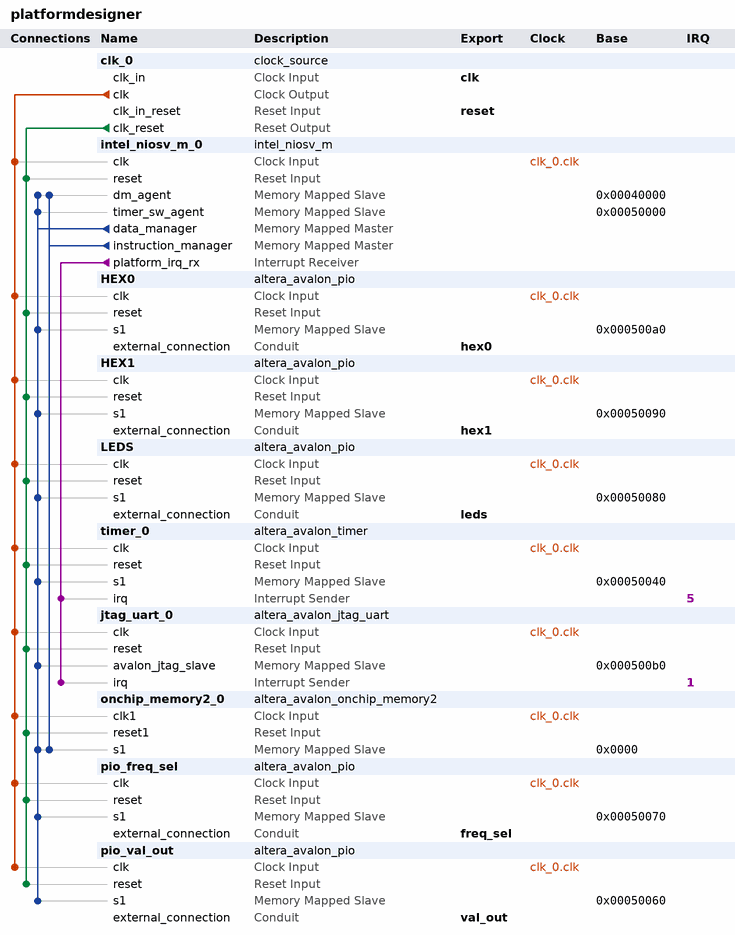
[diagram p0: system contents]
# Platform Designer (Qsys) system platformdesigner, Cyclone V 5CSEMA5F31C6
# Parameters at their usual value, and those the tool derives, are not listed.
package require -exact qsys 24.1
create_system platformdesigner
set_project_property DEVICE_FAMILY {Cyclone V}
set_project_property DEVICE 5CSEMA5F31C6

add_instance clk_0 clock_source 24.1
set_instance_parameter_value clk_0 clockFrequency 50000000

add_instance intel_niosv_m_0 intel_niosv_m 26.0.0
set_instance_parameter_value intel_niosv_m_0 enableAvalonInterface false
set_instance_parameter_value intel_niosv_m_0 enableDebugReset false
set_instance_parameter_value intel_niosv_m_0 enableECCLite false
set_instance_parameter_value intel_niosv_m_0 hartId 0
set_instance_parameter_value intel_niosv_m_0 interruptMode 0
set_instance_parameter_value intel_niosv_m_0 pipelineArch true
set_instance_parameter_value intel_niosv_m_0 resetSlave Absolute

add_instance HEX0 altera_avalon_pio 24.1
set_instance_parameter_value HEX0 direction Output
set_instance_parameter_value HEX0 width 7

add_instance HEX1 altera_avalon_pio 24.1
set_instance_parameter_value HEX1 direction Output
set_instance_parameter_value HEX1 width 7

add_instance LEDS altera_avalon_pio 24.1
set_instance_parameter_value LEDS direction Output
set_instance_parameter_value LEDS width 2

add_instance timer_0 altera_avalon_timer 24.1
set_instance_parameter_value timer_0 period 1
set_instance_parameter_value timer_0 periodUnits MSEC

add_instance jtag_uart_0 altera_avalon_jtag_uart 24.1
set_instance_parameter_value jtag_uart_0 simInteractiveOptions NO_INTERACTIVE_WINDOWS

add_instance onchip_memory2_0 altera_avalon_onchip_memory2 24.1
set_instance_parameter_value onchip_memory2_0 dataWidth 32
set_instance_parameter_value onchip_memory2_0 dualPort false
set_instance_parameter_value onchip_memory2_0 initMemContent true
set_instance_parameter_value onchip_memory2_0 initializationFileName onchip_mem.hex
set_instance_parameter_value onchip_memory2_0 memorySize 262144

add_instance pio_freq_sel altera_avalon_pio 24.1
set_instance_parameter_value pio_freq_sel direction Output
set_instance_parameter_value pio_freq_sel width 2

add_instance pio_val_out altera_avalon_pio 24.1
set_instance_parameter_value pio_val_out direction Output
set_instance_parameter_value pio_val_out width 8

# connections
add_connection clk_0.clk HEX0.clk clock
add_connection clk_0.clk HEX1.clk clock
add_connection clk_0.clk intel_niosv_m_0.clk clock
add_connection clk_0.clk jtag_uart_0.clk clock
add_connection clk_0.clk LEDS.clk clock
add_connection clk_0.clk onchip_memory2_0.clk1 clock
add_connection clk_0.clk pio_freq_sel.clk clock
add_connection clk_0.clk pio_val_out.clk clock
add_connection clk_0.clk timer_0.clk clock
add_connection clk_0.clk_reset HEX0.reset reset
add_connection clk_0.clk_reset HEX1.reset reset
add_connection clk_0.clk_reset intel_niosv_m_0.reset reset
add_connection clk_0.clk_reset jtag_uart_0.reset reset
add_connection clk_0.clk_reset LEDS.reset reset
add_connection clk_0.clk_reset onchip_memory2_0.reset1 reset
add_connection clk_0.clk_reset pio_freq_sel.reset reset
add_connection clk_0.clk_reset pio_val_out.reset reset
add_connection clk_0.clk_reset timer_0.reset reset
add_connection intel_niosv_m_0.data_manager HEX0.s1 avalon
set_connection_parameter_value intel_niosv_m_0.data_manager/HEX0.s1 baseAddress 0x000500a0
add_connection intel_niosv_m_0.data_manager HEX1.s1 avalon
set_connection_parameter_value intel_niosv_m_0.data_manager/HEX1.s1 baseAddress 0x00050090
add_connection intel_niosv_m_0.data_manager intel_niosv_m_0.dm_agent avalon
set_connection_parameter_value intel_niosv_m_0.data_manager/intel_niosv_m_0.dm_agent baseAddress 0x00040000
add_connection intel_niosv_m_0.data_manager intel_niosv_m_0.timer_sw_agent avalon
set_connection_parameter_value intel_niosv_m_0.data_manager/intel_niosv_m_0.timer_sw_agent baseAddress 0x00050000
add_connection intel_niosv_m_0.data_manager jtag_uart_0.avalon_jtag_slave avalon
set_connection_parameter_value intel_niosv_m_0.data_manager/jtag_uart_0.avalon_jtag_slave baseAddress 0x000500b0
add_connection intel_niosv_m_0.data_manager LEDS.s1 avalon
set_connection_parameter_value intel_niosv_m_0.data_manager/LEDS.s1 baseAddress 0x00050080
add_connection intel_niosv_m_0.data_manager onchip_memory2_0.s1 avalon
set_connection_parameter_value intel_niosv_m_0.data_manager/onchip_memory2_0.s1 baseAddress 0x0000
add_connection intel_niosv_m_0.data_manager pio_freq_sel.s1 avalon
set_connection_parameter_value intel_niosv_m_0.data_manager/pio_freq_sel.s1 baseAddress 0x00050070
add_connection intel_niosv_m_0.data_manager pio_val_out.s1 avalon
set_connection_parameter_value intel_niosv_m_0.data_manager/pio_val_out.s1 baseAddress 0x00050060
add_connection intel_niosv_m_0.data_manager timer_0.s1 avalon
set_connection_parameter_value intel_niosv_m_0.data_manager/timer_0.s1 baseAddress 0x00050040
add_connection intel_niosv_m_0.instruction_manager intel_niosv_m_0.dm_agent avalon
set_connection_parameter_value intel_niosv_m_0.instruction_manager/intel_niosv_m_0.dm_agent baseAddress 0x00040000
add_connection intel_niosv_m_0.instruction_manager onchip_memory2_0.s1 avalon
set_connection_parameter_value intel_niosv_m_0.instruction_manager/onchip_memory2_0.s1 baseAddress 0x0000
add_connection intel_niosv_m_0.platform_irq_rx jtag_uart_0.irq interrupt
set_connection_parameter_value intel_niosv_m_0.platform_irq_rx/jtag_uart_0.irq irqNumber 1
add_connection intel_niosv_m_0.platform_irq_rx timer_0.irq interrupt
set_connection_parameter_value intel_niosv_m_0.platform_irq_rx/timer_0.irq irqNumber 5

# exported interfaces
add_interface clk clock sink
set_interface_property clk EXPORT_OF clk_0.clk_in
add_interface freq_sel conduit end
set_interface_property freq_sel EXPORT_OF pio_freq_sel.external_connection
add_interface hex0 conduit end
set_interface_property hex0 EXPORT_OF HEX0.external_connection
add_interface hex1 conduit end
set_interface_property hex1 EXPORT_OF HEX1.external_connection
add_interface leds conduit end
set_interface_property leds EXPORT_OF LEDS.external_connection
add_interface reset reset sink
set_interface_property reset EXPORT_OF clk_0.clk_in_reset
add_interface val_out conduit end
set_interface_property val_out EXPORT_OF pio_val_out.external_connection

set_interconnect_requirement {$system} qsys_mm.clockCrossingAdapter HANDSHAKE
set_interconnect_requirement {$system} qsys_mm.enableEccProtection FALSE
set_interconnect_requirement {$system} qsys_mm.insertDefaultSlave FALSE
set_interconnect_requirement {$system} qsys_mm.maxAdditionalLatency 1

save_system platformdesigner.qsys
